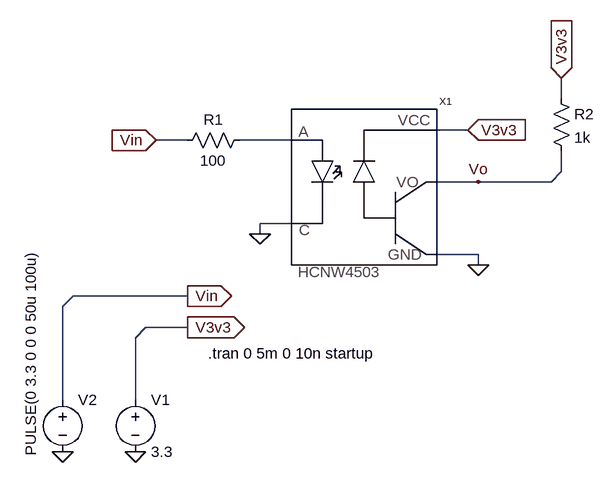
[diagram p0: schematic HCNW4503.asc]
HCNW4503.asc, the LTspice schematic file:
Version 4
SHEET 1 1492 1188
WIRE 64 -480 64 -512
WIRE -80 -432 -128 -432
WIRE -512 -416 -560 -416
WIRE -352 -416 -432 -416
WIRE 64 -368 64 -400
WIRE -64 -352 -128 -352
WIRE 48 -352 64 -368
WIRE 48 -352 -64 -352
WIRE -352 -288 -400 -288
WIRE -400 -272 -400 -288
WIRE -64 -240 -128 -240
WIRE -64 -224 -64 -240
WIRE -512 -176 -688 -176
WIRE -704 -160 -688 -176
WIRE -512 -128 -576 -128
WIRE -592 -112 -576 -128
WIRE -704 -16 -704 -160
WIRE -592 -16 -592 -112
FLAG -64 -224 0
FLAG -400 -272 0
FLAG -704 64 0
FLAG -592 64 0
FLAG -512 -128 V3v3
IOPIN -512 -128 Out
FLAG -80 -432 V3v3
IOPIN -80 -432 In
FLAG 64 -512 V3v3
IOPIN 64 -512 In
FLAG -512 -176 Vin
IOPIN -512 -176 Out
FLAG -64 -352 Vo
FLAG -560 -416 Vin
IOPIN -560 -416 In
SYMBOL voltage -704 -32 R0
WINDOW 123 0 0 Left 0
WINDOW 39 0 0 Left 0
WINDOW 3 -49 102 VLeft 2
SYMATTR Value PULSE(0 3.3 0 0 0 50u 100u)
SYMATTR InstName V2
SYMBOL HCNW4503 -272 -352 R0
SYMATTR InstName X1
SYMATTR ModelFile .\HCNW4503.sub
SYMBOL res -416 -432 R90
WINDOW 0 0 56 VBottom 2
WINDOW 3 32 56 VTop 2
SYMATTR InstName R1
SYMATTR Value 100
SYMBOL voltage -592 -32 R0
WINDOW 123 0 0 Left 0
WINDOW 39 0 0 Left 0
SYMATTR InstName V1
SYMATTR Value 3.3
SYMBOL res 48 -496 R0
SYMATTR InstName R2
SYMATTR Value 1k
TEXT -480 -88 Left 2 !.tran 0 5m 0 10n startup

The netlist it stands for:
* HCNW4503.asc
V2 Vin 0 PULSE(0 3.3 0 0 0 50u 100u)
XX1 N001 0 0 Vo V3v3 HCNW4503  ; pins A C GND VO VCC
R1 N001 Vin 100
V1 V3v3 0 3.3
R2 V3v3 Vo 1k
.tran 0 5m 0 10n startup
.lib .\HCNW4503.sub
.backanno
.end